# EasyEDA Pro project realtix-sakura_nfc-d968f2f9.epro, board PCB2
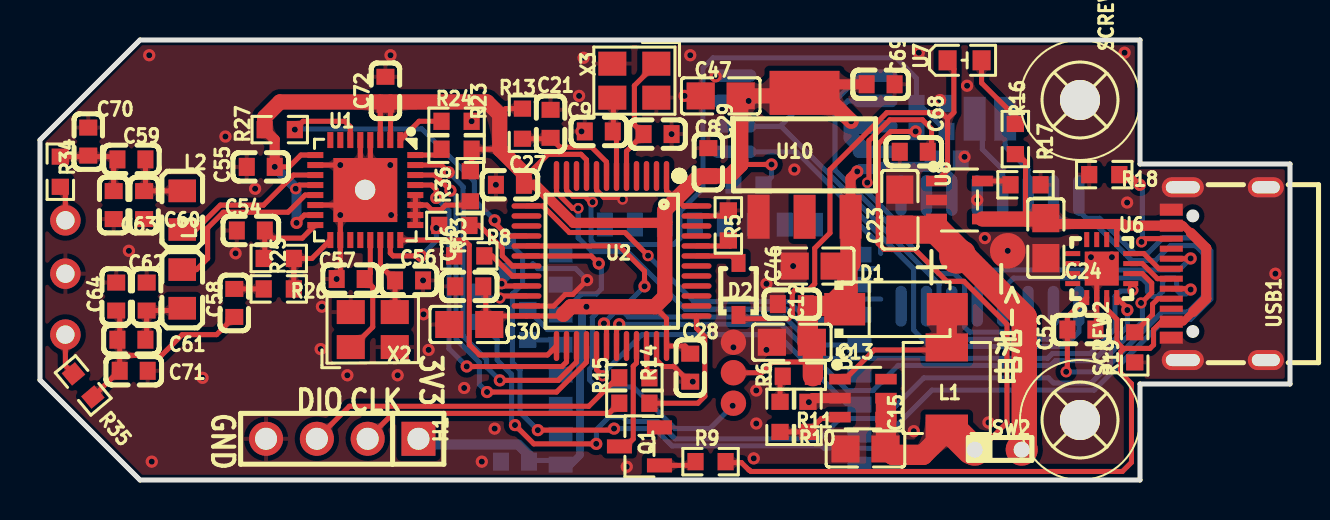
[diagram p8: board, top side]
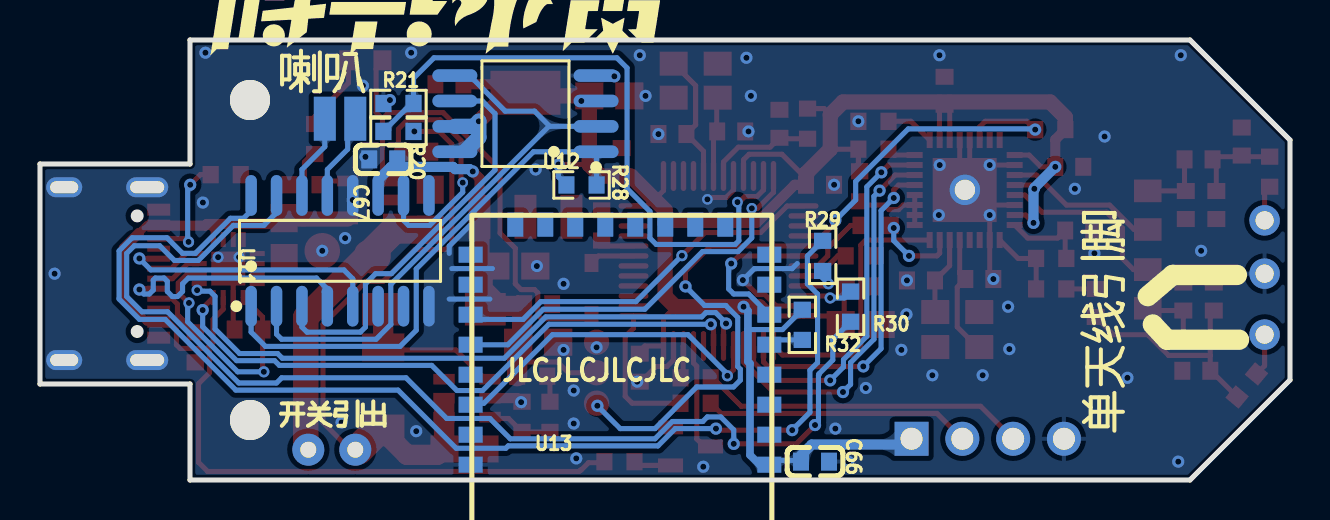
[diagram p9: board, bottom side, seen from below]

Outline 62.5 x 22 mm; copper layers: Top Layer, Bottom Layer. Coordinates in mm from the lower left corner of the outline.
Outline path: 0,17 0,5 5,0 55,0 55,4.8 62.5,4.8 62.5,15.8 55,15.8 55,22 5,22 0,17
Stack: Top Layer 0.035mm / Dielectric1 1.51mm FR4 er 4.5 / Bottom Layer 0.035mm

## Design rules (mm)
net C_UD+: UART
net C_UD-: UART
net CH_DM: MUSIC
net CH_DP: MUSIC
spacing copperThickness1oz (default): track to track 0.102, other pairs 0.152 to 0.3
spacing copperThickness2oz: track to track 0.203, other pairs 0.152 to 0.3
spacing Plane_innerPlane: track to track 0.102, other pairs 0.152 to 0.3
spacing Copper_copperRegion: track to track 0.102, other pairs 0.152 to 0.3
track width copperThickness1oz (default): min 0.127, default 0.254, max 2.54
track width copperThickness2oz: min 0.203, default 0.254, max 2.54
differential pair differentialPair (default): width min 0.127, default 0.254, max 2.54; gap min 0.152, default 0.152
pour e850 uses Copper_copperRegion
pour e947 uses Copper_copperRegion

## Placement (name value [footprint] x y rotation side)
C8  12pF  [C0603]  30.88 17.29 180 top
C9  12pF  [C0603]  27.94 17.43 0 top
C12  100nF  [C0603]  37.59 8.79 0 top
C13  22uF  [C0805]  37.59 6.89 0 top
C15  22uF  [C0805]  41.28 1.55 0 top
C21  100nF  [C0603]  25.53 17.81 90 top
C23  22uF  [C0805]  42.99 13.51 270 top
C24  22uF  [C0805]  50.29 12.09 90 top
C26  100nF  [C0603]  21.46 9.68 0 top
C27  100nF  [C0603]  23.5 14.76 0 top
C28  100nF  [C0603]  32.51 5.62 90 top
C29  100nF  [C0603]  33.42 15.89 270 top
C30  4.7uF  [C0805]  21.46 7.78 0 top
C46  10uF  [C0805]  38.74 10.7 0 top
C47  10uF  [C0805]  34.04 19.21 0 top
C52  100nF  [C0603]  52.07 7.52 180 top
C54  100nF  [C0603]  10.54 12.47 0 top
C55  100nF  [C0603]  11.04 15.66 0 top
C56  18pF  [C0603]  18.45 9.98 0 top
C57  18pF  [C0603]  15.53 10.05 0 top
C58  15pF  [C0603]  9.71 8.85 270 top
C59  22pF  [C0603]  4.57 16.03 180 top
C60  130pF  [C0603]  5.21 13.75 90 top
C61  22pF  [C0603]  4.57 7.01 180 top
C62  130pF  [C0603]  5.33 9.17 90 top
C63  120pF  [C0603]  3.68 13.75 90 top
C64  120pF  [C0603]  3.81 9.17 90 top
C66  100nF  [C0603]  23.75 0.92 0 bottom
C67  1uF  [C0603]  45.34 16.03 180 bottom
C68  1uF  [C0603]  43.69 16.41 0 top
C69  100nF  [C0603]  42.03 19.78 180 top
C70  15pF  [C0603]  2.41 16.92 90 top
C71  15pF  [C0603]  4.69 5.46 180 top
C72  100nF  [C0603]  17.27 19.46 90 top
D1  SS32  [SMA_L4.4-W2.8-LS5.4-RD]  42.8 8.54 0 top
D2  1N5819WS S4  [SOD-323_L1.6-W1.3-LS2.7-RD]  34.93 9.55 90 top
H1  PZ254V-11-04P  [HDR-TH_4P-P2.54-V-M]  15.11 2.06 180 top
L1  4.7uH  [IND-SMD_L4.4-W4.2]  45.34 4.6 90 top
L2  1uH  [L0805]  7.11 13.49 270 top
L3  1uH  [L0805]  7.11 9.55 90 top
NOREF  -  [Pad_e111]  34.67 6.89 270 top
NOREF#2  -  [Pad_e104]  1.27 7.27 0 top
NOREF#3  -  [Pad_e113]  34.67 3.84 270 top
NOREF#4  -  [Pad_e109]  48.26 18.06 0 top
NOREF#5  -  [Pad_e112]  34.67 5.36 270 top
NOREF#6  -  [Pad_e103]  1.27 12.98 0 top
NOREF#7  -  [Pad_e108]  46.74 18.06 0 top
NOREF#8  -  [Pad_e106]  45.85 11.2 90 top
NOREF#9  -  [Pad_e107]  48.39 11.46 90 top
NOREF#10  -  [Pad_e110]  16.26 14.51 270 top
NOREF#11  -  [Pad_e105]  1.27 10.32 0 top
Q1  MMS8050-H-TP  [SOT-23-3_L2.9-W1.3-P1.90-LS2.4-BR]  29.97 1.68 0 top
R5  10K  [R0603]  34.42 12.73 270 top
R6  6.8K  [R0603]  37.89 5.19 0 top
R8  10K  [R0603]  21.46 11.2 0 top
R9  1K  [R0603]  33.53 0.92 0 top
R10  82K  [R0603]  37 3.16 90 top
R11  12K  [R0603]  38.4 3.16 270 top
R13  10K  [R0603]  24.12 17.82 90 top
R14  22R  [R0603]  29.72 3.84 180 top
R15  22R  [R0603]  29.72 5.11 180 top
R16  2K  [R0603]  48.77 17.05 90 top
R17  2K  [R0603]  49.28 14.76 0 top
R18  5.1k  [R0603]  53.21 15.27 180 top
R19  5.1k  [R0603]  54.74 6.63 270 top
R20  33K  [R0603]  44.58 17.43 180 bottom
R21  68K  [R0603]  44.58 18.83 180 bottom
R23  10K  [R0603]  20.83 16.54 0 top
R24  10K  [R0603]  20.83 17.94 0 top
R25  820R  [R0603]  11.94 11.08 0 top
R26  5.1K  [R0603]  11.94 9.55 180 top
R27  10K  [R0603]  11.99 17.52 0 top
R28  10K  [R0603]  35.42 14.75 180 bottom
R29  30R  [R0603]  23.37 11.2 90 bottom
R30  30R  [R0603]  21.97 8.67 270 bottom
R32  10K  [R0603]  24.38 7.76 90 bottom
R33  30R  [R0603]  20.72 12.73 180 top
R34  0.33R  [R0603]  1.02 15.41 90 top
R35  0.33R  [R0603]  2.16 4.73 310 top
R36  10K  [R0603]  21.52 14.69 90 top
SCREW1  -  [M2螺丝]  52 19 0 top
SCREW2  -  [M2螺丝]  52 3 0 top
SW2  MS-12D19-G2  [SW-TH_DEALON_MS-12D19-G2]  48.01 1.55 0 top
U1  13.56MHz  [QFN-32_L5.0-W5.0-P0.50-TL-EP3.1]  16.27 14.5 270 top
U2  STM32F103C8T6  [LQFP-48_L7.0-W7.0-P0.50-LS9.0-BL]  28.57 10.95 180 top
U5  SX1308  [SOT-23-6_L2.9-W1.6-P0.95-LS2.8-BL]  41.15 4.09 270 top
U6  CH343P  [TQFN-16_L3.0-W3.0-P0.50-BL-EP1.7]  53.09 10.57 0 top
U7  YLED0603R  [LED0603-FD]  46.23 20.98 180 top
U8  LTC4054ES5-4.2#TRPBF  [TSOT-23-5_L2.9-W1.6-P0.95-LS2.8-BL]  45.97 14 270 top
U10  -  [SOT_223]  38.23 16.28 0 top
U11  -  [SOP-16_L9.9-W3.9-P1.27-LS6.0-BL]  47.5 11.46 180 bottom
U12  W25Q32JVSSIQ  [SOIC-8_L5.3-W5.3-P1.27-LS8.0-BL]  38.23 18.32 90 bottom
U13  c7d8e8fd7018443ebd857dee17b1e269  [JDY-25M]  41.02 13.24 270 bottom
USB1  TYPE-C16PIN  [USB-C-SMD_TYPE-C16PIN]  58.93 10.32 90 top
X2  27.12MHz  [CRYSTAL-SMD_4P-L3.2-W2.5-BL-1]  16.64 7.52 0 top
X3  8MHz  [CRYSTAL-SMD_4P-L3.2-W2.5-BL]  29.72 19.97 180 top

## Footprints (pads in the part's own frame, mm; a bottom-side part is the same pattern mirrored in y, then rotated)
C0603
  rect 0.8x0.9 smd: 1(-0.7,0) 2(0.7,0)
C0805
  rect 1.41x1.35 smd: 1(-1,0) 2(1,0)
CRYSTAL-SMD_4P-L3.2-W2.5-BL
  rect 1.4x1.2 smd: 1(-1.1,-0.85) 2(1.1,-0.85) 3(1.1,0.85) 4(-1.1,0.85)
CRYSTAL-SMD_4P-L3.2-W2.5-BL-1
  rect 1.4x1.2 smd: 1(-1.1,-0.875) 2(1.1,-0.875) 3(1.1,0.875) 4(-1.1,0.875)
HDR-TH_4P-P2.54-V-M
  rect 1.7x1.7 hole 1.1: 1(-3.81,0)
  round 1.7 hole 1.1: 2(-1.27,0) 3(1.27,0) 4(3.81,0)
IND-SMD_L4.4-W4.2
  rect 1.4x2.12 smd: 1(2.028,0) 2(-2.028,0)
JDY-25M
  rect 0.8x1.2 smd: 1(12.472,14.986) 2(10.972,14.986) 3(9.472,14.986) 4(7.971,14.986) 5(6.471,14.986) 6(4.971,14.986) 7(3.471,14.986) 8(1.972,14.986) 17(1.972,0.051) 18(3.471,0.051) 19(4.971,0.051) 20(6.471,0.051) 21(7.971,0.051) 22(9.472,0.051) 23(10.972,0.051) 24(12.472,0.051)
  rect 1.2x0.8 smd: 9(0.471,12.784) 10(0.471,11.284) 11(0.471,9.784) 12(0.471,8.284) 13(0.471,6.784) 14(0.471,5.284) 15(0.471,3.784) 16(0.471,2.284)
L0805
  rect 1.133x1.377 smd: 1(-0.966,0) 2(0.966,0)
LED0603-FD
  rect 0.9x1 smd: 1(-0.85,0) 2(0.85,0)
LQFP-48_L7.0-W7.0-P0.50-LS9.0-BL
  oval 0.27x1.5 smd: 1(-2.75,-4.25) 2(-2.25,-4.25) 3(-1.75,-4.25) 4(-1.25,-4.25) 5(-0.75,-4.25) 6(-0.25,-4.25) 7(0.25,-4.25) 8(0.75,-4.25) 9(1.25,-4.25) 10(1.75,-4.25) 11(2.25,-4.25) 12(2.75,-4.25) 25(2.75,4.25) 26(2.25,4.25) 27(1.75,4.25) 28(1.25,4.25) 29(0.75,4.25) 30(0.25,4.25) 31(-0.25,4.25) 32(-0.75,4.25) 33(-1.25,4.25) 34(-1.75,4.25) 35(-2.25,4.25) 36(-2.75,4.25)
  oval 1.5x0.27 smd: 13(4.25,-2.75) 14(4.25,-2.25) 15(4.25,-1.75) 16(4.25,-1.25) 17(4.25,-0.75) 18(4.25,-0.25) 19(4.25,0.25) 20(4.25,0.75) 21(4.25,1.25) 22(4.25,1.75) 23(4.25,2.25) 24(4.25,2.75) 37(-4.25,2.75) 38(-4.25,2.25) 39(-4.25,1.75) 40(-4.25,1.25) 41(-4.25,0.75) 42(-4.25,0.25) 43(-4.25,-0.25) 44(-4.25,-0.75) 45(-4.25,-1.25) 46(-4.25,-1.75) 47(-4.25,-2.25) 48(-4.25,-2.75)
M2螺丝
  round 2 hole 2: 1(0,0)
Pad_e103
  round 1.524 hole 0.914: 1(0,0)
Pad_e104
  round 1.524 hole 0.914: 2(0,0)
Pad_e105
  round 1.524 hole 0.914: 1(0,0)
Pad_e106
  round 1.778 smd: 1(0,0)
Pad_e107
  round 1.778 smd: 1(0,0)
Pad_e108
  rect 1.1x2.2 smd far side: 1(0,0)
Pad_e109
  rect 1.1x2.2 smd far side: 2(0,0)
Pad_e110
  round 1.524 hole 1.016: 1(0,0)
Pad_e111
  round 1.27 smd: 1(0,0)
Pad_e112
  round 1.27 smd: 1(0,0)
Pad_e113
  round 1.27 smd: 1(0,0)
QFN-32_L5.0-W5.0-P0.50-TL-EP3.1
  rect 0.8x0.3 smd: 1(-2.5,1.75) 2(-2.5,1.25) 3(-2.5,0.75) 4(-2.5,0.25) 5(-2.5,-0.25) 6(-2.5,-0.75) 7(-2.5,-1.25) 8(-2.5,-1.75) 17(2.5,-1.75) 18(2.5,-1.25) 19(2.5,-0.75) 20(2.5,-0.25) 21(2.5,0.25) 22(2.5,0.75) 23(2.5,1.25) 24(2.5,1.75)
  rect 0.3x0.8 smd: 9(-1.75,-2.5) 10(-1.25,-2.5) 11(-0.75,-2.5) 12(-0.25,-2.5) 13(0.25,-2.5) 14(0.75,-2.5) 15(1.25,-2.5) 16(1.75,-2.5) 25(1.75,2.5) 26(1.25,2.5) 27(0.75,2.5) 28(0.25,2.5) 29(-0.25,2.5) 30(-0.75,2.5) 31(-1.25,2.5) 32(-1.75,2.5)
  rect 3.2x3.2 smd: 33(0,0)
R0603
  rect 0.806x0.864 smd: 1(-0.753,0) 2(0.753,0)
SMA_L4.4-W2.8-LS5.4-RD
  rect 2.046x1.62 smd: 1(-2.566,0) 2(2.566,0)
SOD-323_L1.6-W1.3-LS2.7-RD
  rect 0.9x0.7 smd: 1(-1.3,0) 2(1.3,0)
SOIC-8_L5.3-W5.3-P1.27-LS8.0-BL
  oval 0.63x2.25 smd: 1(-1.905,-3.53) 2(-0.635,-3.53) 3(0.635,-3.53) 4(1.905,-3.53) 5(1.905,3.53) 6(0.635,3.53) 7(-0.635,3.53) 8(-1.905,3.53)
SOP-16_L9.9-W3.9-P1.27-LS6.0-BL
  oval 0.574x2.038 smd: 1(-4.445,-2.769) 2(-3.175,-2.769) 3(-1.905,-2.769) 4(-0.635,-2.769) 5(0.635,-2.769) 6(1.905,-2.769) 7(3.175,-2.769) 8(4.445,-2.769) 9(4.445,2.769) 10(3.175,2.769) 11(1.905,2.769) 12(0.635,2.769) 13(-0.635,2.769) 14(-1.905,2.769) 15(-3.175,2.769) 16(-4.445,2.769)
SOT-23-3_L2.9-W1.3-P1.90-LS2.4-BR
  rect 1.25x0.7 smd: 1(1,-0.95) 2(1,0.95) 3(-1,0)
SOT-23-6_L2.9-W1.6-P0.95-LS2.8-BL
  rect 0.532x1.072 smd: 1(-0.95,-1.149) 2(0,-1.149) 3(0.95,-1.149) 4(0.95,1.149) 5(0,1.149) 6(-0.95,1.149)
SOT_223
  rect 1.1x2.2 smd: 1(-2.299,-3.126) 2(0,-3.126) 3(2.301,-3.126)
  rect 3.5x2.2 smd: 4(0,3.072)
SW-TH_DEALON_MS-12D19-G2
  round 1.6 hole 0.8: 1(-1.27,-0.038) 3(1.079,-0.038)
TQFN-16_L3.0-W3.0-P0.50-BL-EP1.7
  rect 0.25x0.75 smd: 1(-0.749,-1.45) 2(-0.248,-1.45) 3(0.252,-1.45) 4(0.751,-1.45) 9(0.75,1.45) 10(0.25,1.45) 11(-0.25,1.45) 12(-0.749,1.45)
  rect 0.75x0.25 smd: 5(1.45,-0.75) 6(1.45,-0.25) 7(1.45,0.25) 8(1.45,0.75) 13(-1.45,0.75) 14(-1.45,0.25) 15(-1.45,-0.25) 16(-1.45,-0.75)
  rect 1.7x1.7 smd: 17(0.001,0)
TSOT-23-5_L2.9-W1.6-P0.95-LS2.8-BL
  rect 0.532x1.045 smd: 1(-0.95,-1.147) 2(0,-1.147) 3(0.95,-1.147) 4(0.95,1.147) 5(-0.95,1.147)
USB-C-SMD_TYPE-C16PIN
  oval 1x2.1 hole 0.6x1.7: 1(-4.32,1.788) 2(4.32,1.788)
  oval 1x1.8 hole 0.6x1.4: 3(-4.32,-2.362) 4(4.32,-2.362)
  rect 0.6x1.15 smd: A1B12(-3.2,2.362) A4B9(-2.4,2.362) B1A12(3.2,2.362) B4A9(2.4,2.362)
  rect 0.3x1.15 smd: A5(-1.25,2.362) A6(-0.25,2.362) A7(0.25,2.362) A8(-1.75,2.362) B5(1.75,2.362) B6(0.75,2.362) B7(-0.75,2.362) B8(1.25,2.362)

## Nets
As in the schematic, except:
GND: C8.1 C9.1 C12.1 C13.1 C15.1 C21.2 C23.1 C24.1 C26.1 C27.1 C28.1 C29.1 C30.1 C46.1 C47.1 C52.1 C54.1 C55.1 C56.2 C57.1 C60.1 C62.2 C63.1 C64.2 C66.1 C67.1 C68.1 C69.1 C70.2 C71.1 C72.2 H1.4 NOREF.1 NOREF#9.1 NOREF#10.1 NOREF#11.1 Q1.2 R5.1 R8.1 R11.1 R17.2 R18.2 R19.2 R21.1 R24.2 SCREW1.1 SCREW2.1 U1.4 U1.5 U1.10 U1.14 U1.18 U1.33 U2.8 U2.23 U2.35 U2.47 U5.2 U6.2 U6.17 U8.2 U10.1 U11.8 U11.12 U12.4 U13.24 USB1.1 USB1.2 USB1.3 USB1.4 USB1.A1B12 USB1.B1A12 X2.2 X2.4 X3.2 X3.4
VBAT: C15.2 L1.2 R20.2 SW2.1 U5.4 U5.5
BAT: C23.2 NOREF#8.1 SW2.3 U8.3
DI: NOREF#3.1 U2.17
O_5V: C12.2 C13.2 C46.2 C67.2 D1.1 NOREF#5.1 R6.2 U10.3 U11.11
SPK1: NOREF#4.2 U11.14
SPK2: NOREF#7.1 U11.13
$1N19406: NOREF#6.1 R34.1
$1N19434: NOREF#2.2 R35.1

Pads without a net: U1 7 8 19 20; U5 6; U6 10 11 12 13 14 15 16; U10 2; U11 9; U13 2 3 4 9 14 15; USB1 A8 B8

## Via types
v1: diameter 0.61, hole 0.305, Top Layer to Bottom Layer, 87 vias
v2: diameter 0.533, hole 0.305, Top Layer to Bottom Layer, 4 vias
v3: diameter 0.559, hole 0.305, Top Layer to Bottom Layer, 11 vias

## Routing (per net, layer and track width the routed paths; a pad name or vN(x,y) marks a point on that pad's centre or on a via; arc(x,y) is an arc through that point)
3V3: length 111.4
  Top Layer w0.254: U2.9 27.32,16.01 27.05,16.28 25.4,16.28 24.19,15.08 ; U1.12 12.97,14.75 v3(12.78,14.56) ; U1.2 17.53,17.01 17.53,18.9 ; U2.48 32.18,13.7 32,13.87 ; U1.3 17.02,18.9 ; v1(12.83,12.86) 13.22,13.25 U1.15 ; 31.77,14.02 31.32,14.47 U2.1 ; U1.9 13.04,16.25 12.45,15.66 v1(11.74,15.66) ; 26.08,8.2 U2.24 22.76,8.2 22.29,7.73 22.29,9.68 ; 35.04,15.99 35.25,15.78 v1(36.58,15.78) ; 32.64,6.32 32.25,6.7 U2.36 31.32,8.07 30.73,8.66 ; R36.2 21.58,15.51 R23.2 22.99,16.54 ; R13.2 23.29,18.57 22.99,18.27
  Top Layer w0.508: U10.4 38.66,19.78 C69.2 ; v1(11.74,15.66) 11.74,17.02 R27.1 ; 31.24,12.86 26.67,12.86 24.76,14.76 C27.2
  Top Layer w0.762: R27.1 11.23,18.14 12,18.9 22.35,18.9 22.99,18.27 22.99,16.54 24.19,15.33 C27.2 ; 33.41,15.19 32.94,15.19 31.24,13.49 31.24,9.17 30.73,8.66 v1(27.32,8.66) 26.54,8.66 26.16,8.28 ; 33.41,15.19 34.48,15.2 35.04,15.76 C47.2 38.2,19.21 38.23,19.23 39.26,19.23 v1(40.56,17.94) ; 33.41,15.19 C29.2
  Bottom Layer w0.254: v1(36.58,15.78) 36.58,15.15 R28.1 ; U13.1 25.82,0.98 24.45,0.98 ; 27.1,7.52 25.37,7.52 R32.2
  Bottom Layer w0.381: v1(27.32,8.66) 27.3,8.66 27.1,8.46 27.1,5.92 27,5.82 27,1.25 26.52,0.77 U13.1
  Bottom Layer w0.508: 24.45,0.98 24.45,1.24 23.91,1.77 19.21,1.77 H1.1 ; v1(11.74,15.66) 12.78,14.61 v3(12.78,14.56) 12.83,14.52 v1(12.83,12.86)
  Bottom Layer w0.762: U12.7 40.81,17.68 v1(40.56,17.94) 40.56,17.13 41.19,16.5
  vias: v1(35.43,18.95)
GND: length 37.9
  Top Layer w0.254: R5.1 34.14,13.2 U2.47 ; 16.02,14.75 U1.33 16.51,14.75 U1.4 ; 16.02,14.75 v1(15.02,15.75) U1.10 ; 16.02,14.75 U1.5 ; v1(14.83,10.05) 15.02,10.23 U1.18 v1(15.02,13.25) 15.51,13.75 U1.14 ; v1(27.36,9.99) 26.64,9.27 26.26,9.27 25.69,8.7 U2.23 ; U6.17 52.84,10.32 U6.2 52.84,7.59 C52.1 ; U2.8 27.82,14.5 28.19,14.13 29.04,14.13 v2(29.13,14.03) ; U2.35 30.82,6 31.15,5.67 31.69,5.67 32.32,5.04 32.77,5.04
  Top Layer w0.508: U5.2 38.64,4.09 v1(38.44,3.89)
  Bottom Layer w0.254: 24.64,10.82 24.89,10.57 26.78,10.57 v1(27.36,9.99) ; 42.04,9.05 40,9.05 ; 42.04,11.33 42.04,11.7 41.01,12.72 ; 39.88,10.57 41.91,10.57
  vias: v1(4.44,11.46) v1(5.46,21.24) v1(5.59,0.92) v1(8.13,5.11) v1(9.27,17.17) v1(9.78,11.33) v1(10.76,14.56) v1(14.03,6.55) v1(14.1,8.67) v1(15.37,5.24) v1(17.53,21.24) v1(17.51,15.75) v1(17.56,13.25) v1(17.88,5.24) v1(19.15,9.98) v1(19.18,8.28) v1(19.43,6.51) v1(21.21,4.6) v1(21.58,17.94) v1(22.09,0.92) v1(22.73,2.57) v1(22.79,14.76) v1(26.96,19.21) v1(27.08,17.43) v1(27.18,21.11) v1(29.34,0.66) v1(31.58,17.29) v1(32.22,19.21) v1(32.51,21.24) v1(32.64,4.92) v1(33.78,20.18) v1(34.67,6.63) v1(35.69,1.08) v1(35.81,4.47) v1(35.81,2.82) v1(36.32,9.81) v1(36.32,6.51) v1(37.72,15.52) v1(37.66,10.7) v1(43.69,2.44) v1(43.94,21.36) v1(45,19) v1(46.23,16.16) v1(46.35,19.71) v1(46.86,14) v1(47.24,12.09) v1(47.42,2.87) v1(48.39,11.46) v1(54.23,21.36) v1(54.36,13.87) v1(61.77,10.32) v3(52.55,11.14) v3(53.59,11.14)
VBAT: length 29.7
  Top Layer w0.254: v1(43.78,17.43) 42.54,17.43 41.91,16.79 41.91,11.82 42.2,11.53 42.58,11.53 42.58,11.52 43.75,11.52 45.34,9.94 46.19,9.94 48.35,7.78 48.35,2.87 46.86,1.39
  Top Layer w1.016: 45.34,2.45 44.15,1.26 42.64,1.26 42.3,1.6 42.3,3.84
  Top Layer w1.524: 45.34,2.45 45.66,2.45 46.57,1.54
ADC_BAT: length 32.5
  Top Layer w0.254: U2.11 26.32,14.5 26.65,14.17 27.26,14.17 27.54,13.89 v2(27.63,13.89)
  Bottom Layer w0.254: v2(27.63,13.89) 27.56,13.82 27.56,11.96 27.75,11.78 31.69,11.78 32,12.09 32,13.43 33.15,14.57 33.15,20.6 33.66,21.11 42.8,21.11 43.82,20.09 R21.2 43.93,18.83 R20.1
BAT: length 14.6
  Top Layer w1.27: 46.14,11.33 46.14,11.21 49.21,8.14 49.21,1.43
  Top Layer w1.397: 45.97,11.33 44.79,12.51 C23.2
BOOT0: length 1.7
  Top Layer w0.254: U2.44 34.52,11.7 34.54,11.72
C_RX: length 31.6
  Top Layer w0.254: U6.5 54.54,9.6 v3(54.65,9.49) ; U2.30 28.32,7.77 28.27,7.83 v1(28.2,7.83)
  Bottom Layer w0.254: v1(28.2,7.83) 28.38,8 28.38,8.03 28.72,8.37 29.2,8.37 29.42,8.16 37.21,8.16 39.28,6.09 50.38,6.09 50.62,6.32 52.52,6.32 53.75,7.55 53.75,9.19 54,9.44 54.59,9.44 v3(54.65,9.49)
C_TX: length 30.9
  Top Layer w0.254: U2.31 28.82,7.65 v1(28.96,7.79) ; v1(54.37,8.5) 54.37,8.59 U6.4
  Bottom Layer w0.254: v1(54.37,8.5) 54.37,7.66 52.67,5.97 50.77,5.97 50.53,5.73 42.91,5.73 41.66,4.47 40.37,4.47 37.05,7.79 v1(28.96,7.79)
C_UD+: length 2.3
  Top Layer w0.254: USB1.A6 55.87,10.07 55.12,10.82 U6.7
C_UD-: length 2.3
  Top Layer w0.254: U6.8 55.19,11.32 55.95,10.57 USB1.A7
CH_3V3OUT: length 12.6
  Top Layer w0.254: v2(41.36,14.87) 41.45,14.95 41.45,16.96 42.49,18.01 44.12,18.01 44.58,17.56 44.58,16.6 C68.2
  Bottom Layer w0.254: v2(41.36,14.87) 41.36,14.38 43.02,12.73 44.07,12.73 44.32,12.98 44.32,14.23
CH_DM: length 13.5
  Top Layer w0.254: USB1.B7 57.49,9.57 v1(57.53,9.52)
  Bottom Layer w0.254: v1(57.53,9.52) 57.31,9.3 57.03,9.3 56.84,9.5 56.84,9.99 56.73,10.1 56.3,10.1 56.13,9.94 56.13,9.43 55.88,9.17 55.63,9.17 55.37,9.43 55.37,9.81 55.08,10.1 48.68,10.1 48.13,9.55 U11.4
CH_DP: length 13.4
  Top Layer w0.254: v1(57.53,11.08) 57.52,11.07 USB1.B6
  Bottom Layer w0.254: U11.5 46.86,10.06 47.31,10.5 56.96,10.5 v1(57.53,11.08)
CH_RX: length 58.2
  Top Layer w0.254: v1(28.7,2.57) 28.63,2.49 v1(24.89,2.49)
  Bottom Layer w0.254: v1(28.7,2.57) 30.74,2.57 31.6,1.7 39.09,1.7 39.21,1.59 41.69,1.59 44.6,4.5 52.71,4.5 56.24,8.03 57.53,8.03 58.55,9.05 58.55,11.45 57.89,12.11 56.15,12.11 55.37,11.33 54.73,11.33 52.98,13.08 52.32,13.08 51.94,13.47 ; v1(24.89,2.49) 24,3.38 24,5.49 23.62,5.87 23.62,9.3 24.13,9.81 24.13,11.2 R29.2
CH_TX: length 57.3
  Top Layer w0.254: v1(23.75,2.75) 24.69,1.81 v1(27.81,1.81)
  Bottom Layer w0.254: v1(27.81,1.81) 27.81,2.51 28.46,3.15 29.13,3.15 29.36,2.92 30.89,2.92 31.75,2.06 38.99,2.06 40,3.08 42.16,3.08 44.2,5.11 50.42,5.11 50.68,4.85 52.56,4.85 56.12,8.41 57.4,8.41 58.17,9.17 58.17,11.33 57.78,11.71 56.51,11.71 55.78,10.98 54.59,10.98 52.83,12.73 51.31,12.73 50.67,13.36 U11.15 ; R30.2 22.86,7.02 22.86,6 23.56,5.3 23.56,5.24 23.58,5.22 23.58,2.92 v1(23.75,2.75)
CHRG: length 2.2
  Top Layer w0.254: U2.43 34.58,11.2 D2.2
CS-DTA: length 25.6
  Bottom Layer w0.254: R28.2 34.67,16.39 U12.1 37.83,16.41 43.69,10.55 43.69,7.49 44.5,6.68 51.23,6.68 51.94,7.39 51.94,7.93
DI: length 22.3
  Top Layer w0.254: v1(30.23,9.68) 30.23,10.44 28.97,11.7 U2.17
  Bottom Layer w0.254: v1(30.23,9.68) 29.27,8.73 28.21,8.73 27.61,8.13 27.61,5.67 27.48,5.54 27.48,4.99 27.82,4.65 29.67,4.65 31.75,2.57 33.49,2.57 v1(34.63,3.71)
DO-CMD: length 28.2
  Bottom Layer w0.254: 37.01,17.68 37.06,17.68 44.96,9.78 44.96,7.78 45.7,7.04 50.42,7.04 50.67,7.29 50.67,7.93 ; 37.01,17.68 37.77,18.44 39.24,18.44 41.02,20.22 U12.5 ; 37.01,17.68 34.57,17.68
JDY_IN5: length 1.8
  Bottom Layer w0.254: 24.38,7.01 25.79,7.01 U13.5
JDY_PWRC: length 16.5
  Top Layer w0.254: U2.29 27.82,5.52 v3(28.13,5.21)
  Bottom Layer w0.254: v3(28.13,5.21) 28.13,5.3 30.1,7.27 36.87,7.27 40.3,3.84 40.66,3.84
JDY_RX: length 20
  Top Layer w0.254: v2(26.91,13.58) 26.62,13.58 25.82,14.38 U2.12
  Bottom Layer w0.254: v2(26.91,13.58) 26.91,12.11 27.6,11.42 29.38,11.42 32.26,8.54 37.33,8.54 39.11,6.76 40.96,6.76 U13.20
JDY_STAT: length 7.7
  Top Layer w0.254: U2.18 27.56,11.2 v1(27.94,10.82)
  Bottom Layer w0.254: U13.6 27.07,9.3 27.81,9.3 28.07,9.55 28.07,10.7 v1(27.94,10.82)
JDY_TX: length 19.1
  Top Layer w0.254: v3(30.4,11.22) 29.25,12.37 26.47,12.37 25.14,13.7 U2.13
  Bottom Layer w0.254: U13.19 40.73,8.03 38.34,8.03 37.46,8.92 32.7,8.92 v3(30.4,11.22)
NRST: length 5.4
  Top Layer w0.254: R13.1 25.48,17.06 C21.1 26,16.64 27.59,16.64 28.32,15.9 U2.7
O_5V: length 22.8
  Top Layer w0.254: 38.64,6 38.54,5.9 36.62,5.9 36.08,5.36 NOREF#5.1
  Top Layer w0.508: 40.53,13.03 40.53,15.09 v1(40.86,15.43)
  Top Layer w1.016: 40.53,13.03 40.53,10.86 40.37,10.7 40.37,9.54 ; 40.37,9.54 39.53,8.7 38.61,8.7 38.39,8.48 38.39,6.85 38.64,6.6 R6.2 ; 40.37,9.54 40.37,8.79
  Bottom Layer w0.508: U11.11 45.59,15.02 44.96,15.65 41.85,15.65 41.74,15.54 41.02,15.54 40.91,15.43 v1(40.86,15.43)
OSC_IN: length 6.6
  Top Layer w0.254: X3.1 29.72,19.72 29.72,17.76 C8.2 29.32,16.44 U2.5
OSC_OUT: length 4
  Top Layer w0.254: X3.3 28.67,19.07 28.67,17.31 28.82,17.16 U2.6
PA6: length 18.2
  Top Layer w0.254: U1.6 15.51,17.66 15.24,17.94 13.16,17.94 v1(12.74,17.52) ; U2.16 23.39,12.2 22.73,12.86 v1(22.73,12.98)
  Bottom Layer w0.254: v1(22.73,12.98) 21.72,14 21.72,14.93 19.09,17.56 12.78,17.56 v1(12.74,17.52)
PA12: length 5.6
  Top Layer w0.254: U2.33 29.82,5.85 29.66,5.69 29.66,2.05 29.29,1.68 Q1.3
PA13: length 1.6
  Top Layer w0.254: U2.34 30.34,6.68 30.34,5.11
PA14: length 7.1
  Top Layer w0.254: U2.37 32.82,7.59 33.24,7.17 33.24,4.19 32.89,3.84 R14.1
PB1: length 3.9
  Top Layer w0.254: R33.1 21.97,12.73 23.11,11.59 23.11,11.2 23.62,10.7 U2.19
PB2(BT1): length 2.4
  Top Layer w0.254: 22.34,11.2 22.61,11.2 23.61,10.2 U2.20
PB10: length 2
  Top Layer w0.254: v3(23.08,9.81) 23.19,9.7 U2.21
  Bottom Layer w0.254: v3(23.08,9.81) 23.37,10.1 R29.1
PB11: length 2.5
  Top Layer w0.254: U2.22 23.09,9.2 v3(22.99,9.1)
  Bottom Layer w0.254: R30.1 22.29,9.1 v3(22.99,9.1)
PB12: length 13.3
  Top Layer w0.254: U1.24 21.21,12 21.46,11.74 21.46,6.76 21.97,6.25 25.38,6.25 U2.25
PB13: length 16.5
  Top Layer w0.254: v1(21.34,5.68) 21.34,5.67 26.09,5.67 26.32,5.9 U2.26 ; 18.76,14.75 19.57,14.75 19.81,14.51 v1(19.81,14.1)
  Bottom Layer w0.254: v1(19.81,14.1) 20.45,13.47 20.45,6.57 v1(21.34,5.68)
PB14: length 18.3
  Top Layer w0.254: v1(20.43,15.38) 20.07,15.75 18.76,15.75 ; v1(22.99,4.98) 25.91,4.98 26.82,5.9 U2.27
  Bottom Layer w0.254: v1(20.43,15.38) 21.16,14.66 21.16,7.19 22.33,6.02 22.33,5.65 v1(22.99,4.98)
PB15: length 19.3
  Top Layer w0.254: v1(22.35,4.4) 25.83,4.4 27.32,5.9 U2.28 ; 18.76,15.25 19.74,15.25 v1(20.52,14.47)
  Bottom Layer w0.254: v1(22.35,4.4) 21.97,4.78 21.97,5.87 20.8,7.04 20.8,14.19 v1(20.52,14.47)
RC_IRQ: length 4
  Top Layer w0.254: U1.23 17.51,11.34 17.65,11.2 v1(19.05,11.2)
  Bottom Layer w0.254: v1(19.81,12.6) 19.81,11.97 v1(19.05,11.2)
RC_RX: length 11.5
  Top Layer w0.254: C58.2 8.83,7.27 7.11,7.27 6.07,6.23 3.99,6.23 ; C64.1 3.99,8.3 3.99,6.23 ; 3.99,6.23 C71.2 3.95,5.46 2.64,4.15
RC_TX1: length 7.8
  Top Layer w0.254: U1.11 12.68,15.25 11.18,13.75 9.02,13.75 7.8,12.53 L2.2
RC_TX2: length 9.1
  Top Layer w0.254: U1.13 13.26,14.25 12.4,13.39 9.17,13.39 8.38,12.6 8.38,11.08 7.82,10.52 L3.2
SCK-CLK: length 19.8
  Bottom Layer w0.254: U12.6 40.39,18.95 39.75,18.32 39.75,15.49 44.93,10.32 45.72,10.32 46.23,9.81 46.23,7.65 46.49,7.39 49.15,7.39 49.4,7.65 49.4,7.93
SPK1: length 4.2
  Bottom Layer w0.254: U11.14 49.4,15.52 48.26,16.67 48.26,17.94
SPK2: length 4.3
  Bottom Layer w0.254: 46.74,17.94 47.12,17.56 47.12,16.54 48.13,15.52 U11.13
USB5V: length 53.7
  Top Layer w0.254: U6.3 53.34,8.54 53.85,8.03 53.85,6.89 54.15,6.58 ; R16.1 48.89,16.29 49.28,15.9 49.28,13.09 49.32,13.05 ; USB1.A4B9 56.07,7.92 55.68,7.52 55.68,6.76 55.5,6.58 54.15,6.58 ; U6.9 53.84,12.48 54.16,12.8 ; 54.15,6.58 54.15,6.53 54.03,6.4 54.03,5.36 54.57,4.81 54.57,0.88 54.12,0.43 35.54,0.43 35.47,0.5 35.44,0.5 35.07,0.87 34.56,0.87
  Top Layer w0.381: 57.66,8.41 57.16,7.92 USB1.A4B9 ; 57.1,12.72 57.19,12.72 57.55,12.36
  Top Layer w0.508: 57.66,8.41 58.31,9.07 58.31,11.59 57.55,12.36 ; C24.2 50.59,12.8 54.16,12.8 54.24,12.72 57.1,12.72
  Top Layer w0.762: U8.4 50.25,13.05 C24.2
$1N2154: length 16.5
  Top Layer w0.254: H1.3 15.47,3.69 27.44,3.69 28.73,4.98 29.09,4.98
$1N2155: length 13.7
  Top Layer w0.254: 29.22,3.97 29.17,4.02 29.14,4.02 28.45,3.33 17.65,3.33 H1.2
$1N3217: length 5.7
  Top Layer w0.254: v3(55.07,11.9) 55.24,12.07 USB1.B5 ; v1(54.99,14.76) 54.48,15.27 R18.1
  Bottom Layer w0.254: v1(54.99,14.76) 55.12,14.63 55.12,11.95 v3(55.07,11.9)
$1N3218: length 2.8
  Top Layer w0.254: USB1.A5 55.9,9.07 55.63,8.79 55.63,8.28 R19.1
$1N3223: length 8
  Top Layer w0.254: 45.34,6.5 41.71,6.5 40.25,5.04 U5.1
  Top Layer w1.016: 45.34,6.5 45.34,7.88 45.36,7.9 D1.2
$1N3227: length 3.1
  Top Layer w0.254: 39.81,3.08 39.07,3.08 R11.2 R10.1
$1N3231: length 24.9
  Top Layer w0.254: 45.38,18.06 45.07,18.37 42.34,18.37 39.5,15.52 39.5,12.35 38.74,11.59 38.74,9.81 38.45,9.52 37.78,9.52 37.61,9.36 37.61,8.25 37.42,8.06 35.12,8.06 D2.1 ; 45.38,18.06 45.38,15.5 U8.1 ; 45.38,18.06 45.69,18.38 45.69,20.54 45.38,20.86
$1N3232: length 1.5
  Top Layer w0.254: U8.5 48.33,14.95 R17.1
$1N3240: length 1.3
  Top Layer w0.254: R6.1 37,5.05 R10.2
$1N3241: length 3.9
  Top Layer w0.254: R16.2 48.77,18.16 47.08,19.85 U7.1
$1N3246: length 2.4
  Top Layer w0.254: R9.1 32.78,0.92 32.97,0.73 Q1.1 30.91,0.79
$1N3263: length 12.4
  Top Layer w0.254: U6.1 51.37,8.15 C52.2 51.37,5.47 v3(51.31,5.41) ; U6.6 55.11,10.32 55.59,9.85 55.59,9.37 55.07,8.85 v3(55.05,8.85)
  Bottom Layer w0.254: v3(51.31,5.41) 52.62,5.41 55.12,7.91 55.12,8.79 v3(55.05,8.85)
$1N3683: length 2.4
  Top Layer w0.254: R24.1 18.95,17.94 U1.1
$1N3742: length 1.4
  Top Layer w0.254: R23.1 19.78,16.25 18.76,16.25
$1N3828: length 3.7
  Top Layer w0.254: U1.17 13.6,11.08 R25.2 R26.1
$1N3888: length 4.4
  Top Layer w0.254: U1.16 13.11,12.09 11.62,12.09 C54.2 11.24,11.11 11.29,11.06
$1N4680: length 6.1
  Top Layer w0.254: X2.1 15.63,6.65 16.64,7.65 16.64,9.64 C57.2 16.51,10.33 U1.21
$1N4685: length 3.9
  Top Layer w0.254: X2.3 17.75,8.41 C56.1 17.02,10.72 17.02,12 U1.22
$1N5396: length 3.5
  Top Layer w0.254: L2.1 5.22,14.46 ; 5.22,14.46 5.21,14.44 ; 5.22,14.46 5.27,14.51 C59.1
$1N5401: length 3.3
  Top Layer w0.254: C61.1 5.33,7.08 C62.1 7,8.47 L3.1
$1N5405: length 4.6
  Top Layer w0.254: 3.68,14.44 3.68,15.84 C59.2 3.74,16.17 1.02,16.17
$1N19406: length 1.8
  Top Layer w0.254: NOREF#6.1 1.27,14.41 R34.1
$1N19434: length 2.1
  Top Layer w0.254: NOREF#2.2 1.27,5.71 1.67,5.31
$1N19556: length 1.5
  Top Layer w0.254: R26.2 C58.1
$1N19599: length 4.5
  Top Layer w0.254: 18.76,13.75 18.76,12.75 ; 18.76,13.75 19.34,13.75 19.57,13.52 20.05,13.52 20.28,13.75 21.33,13.75 R36.1 ; 18.76,13.75 18.76,14.25

## Copper pours and planes (outline as drawn; the poured copper is in the pictures)
GND on Top Layer: -1.27,23.14 64.52,23.14 64.52,-3.02 -1.27,-3.02
GND on Bottom Layer: -2.54,24.29 66.42,24.29 66.42,-4.29 -2.54,-4.29

Small or netless copper shapes (teardrops, artwork), in the pictures only: 201 on Top Layer, 62 on Bottom Layer

## Text on the board
Bottom Silkscreen Layer: JLCJLCJLCJLC | 开关引出 | 喇叭 | 单天线引脚
Document Layer: GND | 5V | DI
Top Silkscreen Layer: DIO | CLK | GND | 3V3 | + | - | 电池->
